# Altium schematic sheet single_bridge.SchDoc
size A4; SheetNumber: 5; SheetTotal: 5
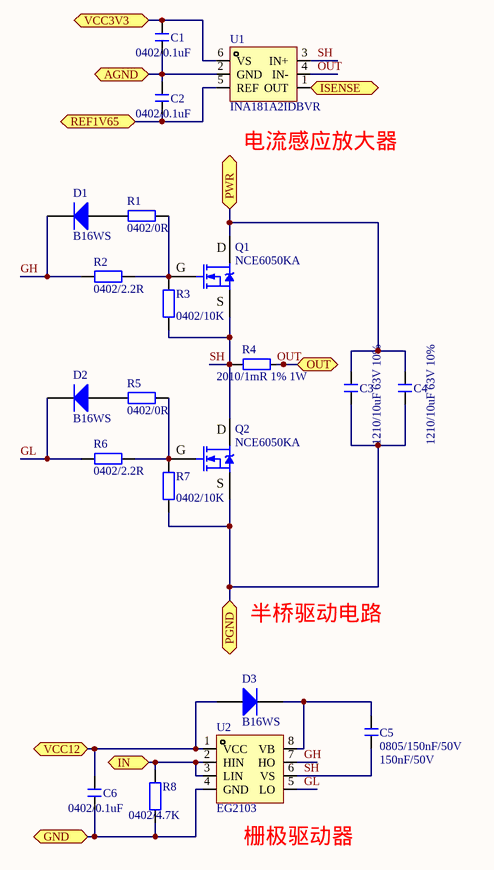
[diagram p0: single_bridge.SchDoc]

## Parts
C1  0402/0.1uF  [0402C]
C2  0402/0.1uF  [0402C]
C3  1210/10uF 63V 10%  [1210C]
C4  1210/10uF 63V 10%  [1210C]
C5  0805/150nF/50V  value 150nF/50V  [0805C]
C6  0402/0.1uF  [0402C]
D1  B16WS  [SOD-323]
D2  B16WS  [SOD-323]
D3  B16WS  [SOD-323]
Q1  NCE6050KA  [TO252]
Q2  NCE6050KA  [TO252]
R1  0402/0R  [0402R]
R2  0402/2.2R  [0402R]
R3  0402/10K  [0402R]
R4  2010/1mR 1% 1W  [2010R]
R5  0402/0R  [0402R]
R6  0402/2.2R  [0402R]
R7  0402/10K  [0402R]
R8  0402/4.7K  [0402R]
U1  INA181A2IDBVR  [SOT23-6]
U2  EG2103  [SOP8 - short]

## Ports
AGND (bidir), GND (bidir), IN (bidir), ISENSE (bidir), OUT (bidir), PGND (bidir), PWR (bidir), REF1V65 (bidir), VCC3V3 (bidir), VCC12 (bidir)

## Nets
AGND: C1.1 C2.2 U1.2(GND) ; port AGND
GH: D1.2(K) R2.1 U2.7(HO)
GL: D2.2(K) R6.1 U2.5(LO)
GND: C6.1 R8.1 U2.4(GND) ; port GND
IN: R8.2 U2.2(HIN) U2.3(LIN) ; port IN
ISENSE: U1.1(OUT) ; port ISENSE
OUT: R4.1 U1.4(IN-) ; port OUT
PGND: C3.1 C4.1 Q2.3(S) R7.1 ; port PGND
PWR: C3.2 C4.2 Q1.2(D) ; port PWR
REF1V65: C2.1 U1.5(REF) ; port REF1V65
SH: C5.2 Q1.3(S) Q2.2(D) R3.1 R4.2 U1.3(IN+) U2.6(VS)
VCC3V3: C1.2 U1.6(VS) ; port VCC3V3
VCC12: C6.2 D3.1(A) U2.1(VCC) ; port VCC12
NetC5_1: C5.1 D3.2(K) U2.8(VB)
NetD1_1: D1.1(A) R1.1
NetD2_1: D2.1(A) R5.1
NetQ1_1: Q1.1(G) R1.2 R2.2 R3.2
NetQ2_1: Q2.1(G) R5.2 R6.2 R7.2

## Notes on the sheet
- (near U1) 电流感应放大器
- 半桥驱动电路
- (near U2) 栅极驱动器

## Library data of the parts
C1 C2 C6 = C: 贴片电容; value: 0.1uF; 嘉立创元件编号: C110251
C3-C5 = C: 贴片电容
  C3 C4: value: 10uF 63V 10%; 嘉立创元件编号: C437568
  C5: 嘉立创元件编号: C376934
D1-D3 = B16WS: 肖特基二极管 60V 1A; 嘉立创元件编号: C7420327
Q1 Q2 = NCE6050KA: N沟场效应管60V50A; BOM名称: N沟场效应管; 嘉立创元件编号: C96013
R1 R5 = R: 贴片电阻; value: 0R; 嘉立创元件编号: C17168
R2 R6 = R: 贴片电阻; value: 2.2R; 嘉立创元件编号: C25101
R3 R7 = R: 贴片电阻; value: 10K; 嘉立创元件编号: C25744
R4 = R: 贴片电阻; value: 1mR 1% 1W; 嘉立创元件编号: C2094559
R8 = R: 贴片电阻; value: 4.7K; 嘉立创元件编号: C25900
U1 = INA181A2IDBVR: 单路，高共模电压，50V/V电流放大器; 嘉立创元件编号: C2058784
U2 = EG2103: 大功率栅极驱动器; 嘉立创元件编号: C480654